# Altium schematic sheet Current_Sense_Section.SchDoc
size 420 x 297 mm; DocumentNumber: 5; SheetNumber: 5; SheetTotal: 17
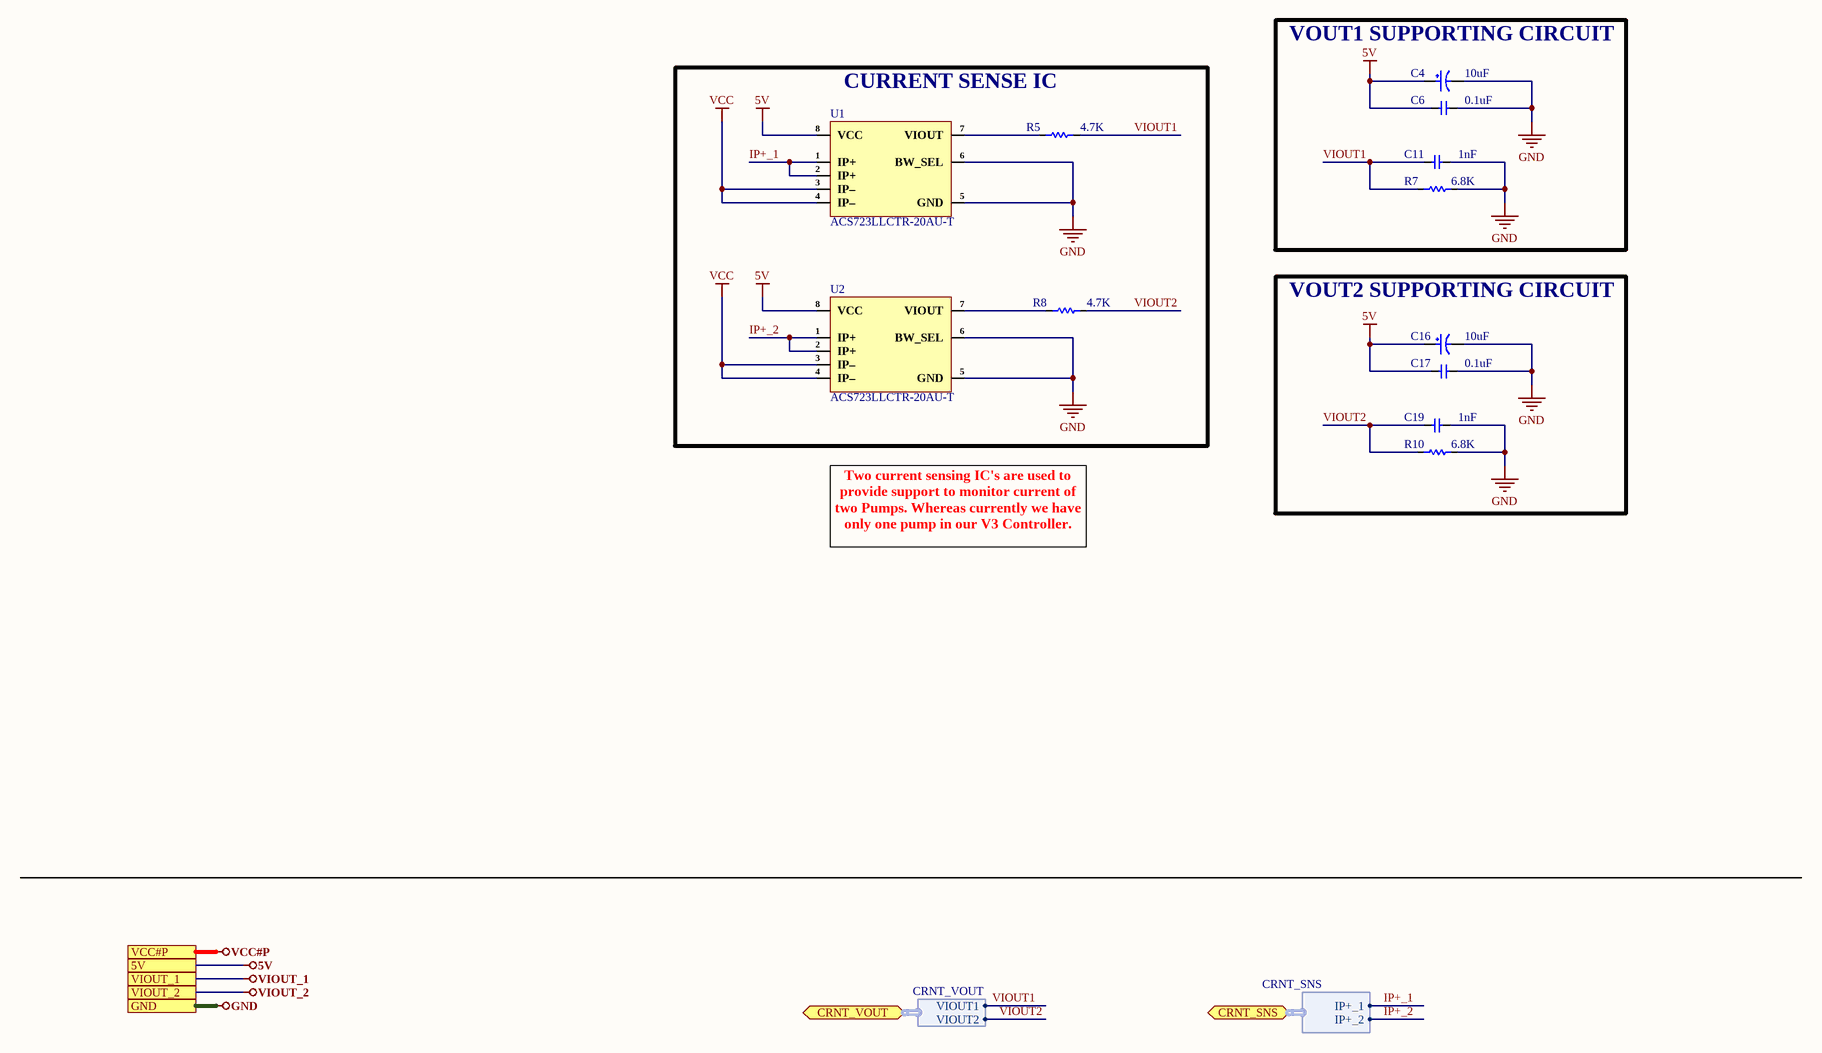
[diagram p0: Current_Sense_Section.SchDoc]

## Parts
C4  10uF  [RVT1E100M0405_]
C6  0.1uF  [Cap-0603]
C11  1nF  [Cap-0402]
C16  10uF  [RVT1E100M0405_]
C17  0.1uF  [Cap-0603]
C19  1nF  [Cap-0402]
R5  4.7K  [Res-0603]
R7  6.8K  [Res-0603]
R8  4.7K  [Res-0603]
R10  6.8K  [Res-0603]
U1  ACS723LLCTR-20AU-T  [SOP-8]
U2  ACS723LLCTR-20AU-T  [SOP-8]

## Blocks framed on the sheet
VOUT1 SUPPORTING CIRCUIT: C4 C6 C11 R7
CURRENT SENSE IC: R5 R8 U1 U2
VOUT2 SUPPORTING CIRCUIT: C16 C17 C19 R10

## Ports
5V, CRNT_SNS (bidir, harness CRNT_SNS), CRNT_VOUT (bidir, harness CRNT_VOUT), GND, VCC#P, VIOUT_1, VIOUT_2

## Harnesses
CRNT_SNS: IP+_1, IP+_2
CRNT_VOUT: VIOUT1, VIOUT2

## Nets
5V: C4.1 C6.1 C16.1 C17.1 U1.8(VCC) U2.8(VCC) ; port 5V
GND: C4.2 C6.2 C11.2 C16.2 C17.2 C19.2 R7.2 R10.2 U1.5(GND) U1.6(BW_SEL) U2.5(GND) U2.6(BW_SEL) ; port GND
VCC: U1.3(IP–) U1.4(IP–) U2.3(IP–) U2.4(IP–)
VCC#P: port VCC#P
VIOUT_1: port VIOUT_1
VIOUT_2: port VIOUT_2
IP+_1: U1.1(IP+) U1.2(IP+) ; port CRNT_SNS.IP+_1
IP+_2: U2.1(IP+) U2.2(IP+) ; port CRNT_SNS.IP+_2
VIOUT1: C11.1 R5.2 R7.1 ; port CRNT_VOUT.VIOUT1
VIOUT2: C19.1 R8.2 R10.1 ; port CRNT_VOUT.VIOUT2
NetR5_1: R5.1 U1.7(VIOUT)
NetR8_1: R8.1 U2.7(VIOUT)

## Notes on the sheet
- Two current sensing IC's are used to provide support to monitor current of two Pumps. Whereas currently we have only one pump in our V3 Controller.
- File:
- Title:
- Date:
- Page
- Num:
- Total:
- Drawn By: Huzaifa Ali

## Library data of the parts
C4 C16 = RVT1E100M0405: CAP ALUM 10uF 25V SMD; Manufacturer: ROQANG; φD: 4mm; L: 5.4mm; Tolerance: ±20%; Item Type: Capacitor; Operating Temperature: -45℃~+105℃; Rated Voltage: 25V; Capacitance: 10uF; Manufacturer Part Number: RVT1E100M0405; ComponentLink1Description: LCSC; ComponentLink1URL: https://www.lcsc.com/product-detail/Aluminum-Electrolytic-Capacitors-SMD_10uF-25V-20_C72484.html; LCSC Part Number: C970655
C6 C17 = CC0603ZRY5V9BB104: CAP CER 0.1UF 50V Y5V 0603; Manufacturer: Yageo; Capacitance: 100nF; Tolerance: 80%; Item Type: Capacitor; Supplier 1: Digi-Key; Manufacturer Part Number: CC0603ZRY5V9BB104; Stock 1: 15000880; Pricing 1: 1=0.1, 10=0.075, 100=0.0334, 500=0.02386, 1000=0.01874 (USD); Mount: Surface Mount; Case/Package: 0603; Number of Pins: 2; Case Code (Metric): 1608; Case Code (Imperial): 0603; Min Operating Temperature: -30°C; Max Operating Temperature: 85°C; Dielectric: Y5V; Voltage Rating: 50V; Package Quantity: 1; Packaging: Tape and Reel; Voltage Rating (DC): 50V; Termination: SMD/SMT; Composition: Ceramic; Voltage: 50V; Length: 1.6mm; Height: 0.8mm; Width: 0.031inch; Thickness: 0.035inch; Depth: 0.8mm; Radiation Hardening: No; REACH SVHC: No SVHC; Lead Free: Lead Free; Halogen Free: Halogen Free; ComponentLink1URL: http://www.yageo.com/documents/recent/UPY-GPHC_Y5V_6.3V-to-50V_8.pdf?src-supplier=Digi-Key; ComponentLink1Description: http://www.yageo.com/documents/recent/UPY-GPHC_Y5V_6.3V-to-50V_8.pdf?src-supplier=Digi-Key; ComponentLink2URL: http://www.yageo.com/documents/recent/UPY-GPHC_Y5V_6.3V-to-50V_5.pdf?src-supplier=Avnet+Europe; ComponentLink2Description: http://www.yageo.com/documents/recent/UPY-GPHC_Y5V_6.3V-to-50V_5.pdf?src-supplier=Avnet+Europe; ComponentLink3URL: https://www.verical.com/server-webapp/html/getDatasheet?partID=403611&src-supplier=Verical; ComponentLink3Description: https://www.verical.com/server-webapp/html/getDatasheet?partID=403611&src-supplier=Verical; ComponentLink4URL: http://www.mouser.com/ds/2/447/Yageo_UPY-GP_NP0_16V-to-50V_9-358835.pdf?src-supplier=Mouser; ComponentLink4Description: http://www.mouser.com/ds/2/447/Yageo_UPY-GP_NP0_16V-to-50V_9-358835.pdf?src-supplier=Mouser; ComponentLink5URL: http://www.farnell.com/datasheets/1132289.pdf?src-supplier=Element14; ComponentLink5Description: http://www.farnell.com/datasheets/1132289.pdf?src-supplier=Element14; Supplier Part Number 1: 311-1343-1-ND; LCSC Part Number: C106221
C11 C19 = C1005C0G1E102JT000F: CAP CER 1000PF 25V C0G 0402; Manufacturer: TDK; Item Type: Capacitor; ComponentLink1Description: LCSC; ComponentLink1URL: https://www.lcsc.com/product-detail/Multilayer-Ceramic-Capacitors-MLCC-SMD-SMT_TDK-C1005C0G1E102JT000F_C343059.html; Manufacturer Part Number: C1005C0G1E102JT000F; Package: 0402; LCSC Part Number: C343059
R5 R8 = RT0603BRD074K7L: RES SMD 4.7K OHM 0.1% 1/10W 0603; Manufacturer: Yageo; Item Type: Resistor; Supplier: Digikey; LCSC Part Number: C513565; Manufacturer Part Number: RT0603BRD074K7L; RoHS: Yes; Stock: 5683; Pricing: 1=0.14, 10=0.097, 50=0.0796, 100=0.0714, 500=0.05712, 1000=0.0561 (USD); ComponentLink1URL: https://datasheet.ciiva.com/12836/pyu-rt-1-to-0-05-rohs-l-4-12836232.pdf?src-supplier=Mouser; ComponentLink1Description: https://datasheet.ciiva.com/12836/pyu-rt-1-to-0-05-rohs-l-4-12836232.pdf?src-supplier=Mouser; ComponentLink2URL: https://datasheet.ciiva.com/2585/pyu-rt-1-to-0-05-rohs-l-4-2585982.pdf?src-supplier=Digikey; ComponentLink2Description: https://datasheet.ciiva.com/2585/pyu-rt-1-to-0-05-rohs-l-4-2585982.pdf?src-supplier=Digikey; ComponentLink3URL: https://datasheet.ciiva.com/46635/pyu-rt-1-to-0-05-rohs-l-5-46635032.pdf?src-supplier=Digikey; ComponentLink3Description: https://datasheet.ciiva.com/46635/pyu-rt-1-to-0-05-rohs-l-5-46635032.pdf?src-supplier=Digikey
R7 R10 = RT0603BRE076K8L: RES SMD 6.8K OHM 0.1% 1/10W 0603; Manufacturer: Yageo; Power: 100mW; Rated Temperature: 70°C; Value: 6.8kR; Temperature Coefficient: 50ppm/°C; Working Voltage: 75V; Package Height: 0.45mm; Package Length: 1.6mm; Package Width: 0.8mm; Item Type: Resistor; Supplier 1: Mouser; Manufacturer Part Number: RT0603BRE076K8L; RoHS: Yes; Category: Chip SMD Resistors; Stock 1: 1191; Pricing 1: 1=0.32000, 10=0.26800, 50=0.26800, 100=0.10500, 1000=0.04400, 10000=0.03600 (USD); Mounting Technology: Surface Mount; Pins: 2; Case/Package: 0603; Min Operating Temperature: -55°C; Max Operating Temperature: 155°C; Tolerance: 0.1%; Resistor Type: FIXED RESISTOR; Construction: Chip; Package Style: SMTMeter; Packaging: Tape and Reel; Technology: THIN FILM; Termination: Wraparound; Reach SVHC Compliant: Yes; RoHS Compliant: Yes; ComponentLink1URL: https://datasheet.ciiva.com:443/pdfs/VipMasterIC/IC/YAGO/YAGO-S-A0008510989/YAGO-S-A0008510989-1.pdf?src-supplier=IHS+Markit; ComponentLink1Description: https://datasheet.ciiva.com:443/pdfs/VipMasterIC/IC/YAGO/YAGO-S-A0008510989/YAGO-S-A0008510989-1.pdf?src-supplier=IHS+Markit; ComponentLink2URL: https://datasheet.ciiva.com/2584/pyu-rt-1-to-0-05-rohs-l-5-2584607.pdf?src-supplier=Digi-Key; ComponentLink2Description: https://datasheet.ciiva.com/2584/pyu-rt-1-to-0-05-rohs-l-5-2584607.pdf?src-supplier=Digi-Key; Supplier Part Number 1: 603-RT0603BRE076K8L; LCSC Part Number: C705876
U1 U2 = ACS723LLCTR-20AU-T: SENSOR CURRENT HALL 20A DC; Manufacturer: Allegro MicroSystems, LLC; Item Type: Current Sensor; Manufacturer Part Number: ACS723LLCTR-20AU-T; Package: SOP-8; LCSC Part Number: C459324; ComponentLink4URL: https://www.lcsc.com/product-detail/Current-Sensors_Allegro-MicroSystems-span-style-background-color-ff0-LLC-span-ACS723LLCTR-20AU-T_C459324.html; ComponentLink4Description: LCSC